# Altium schematic sheet USB2.0_SHEET.SchDoc
size A4; SheetNumber: 22; SheetTotal: 23
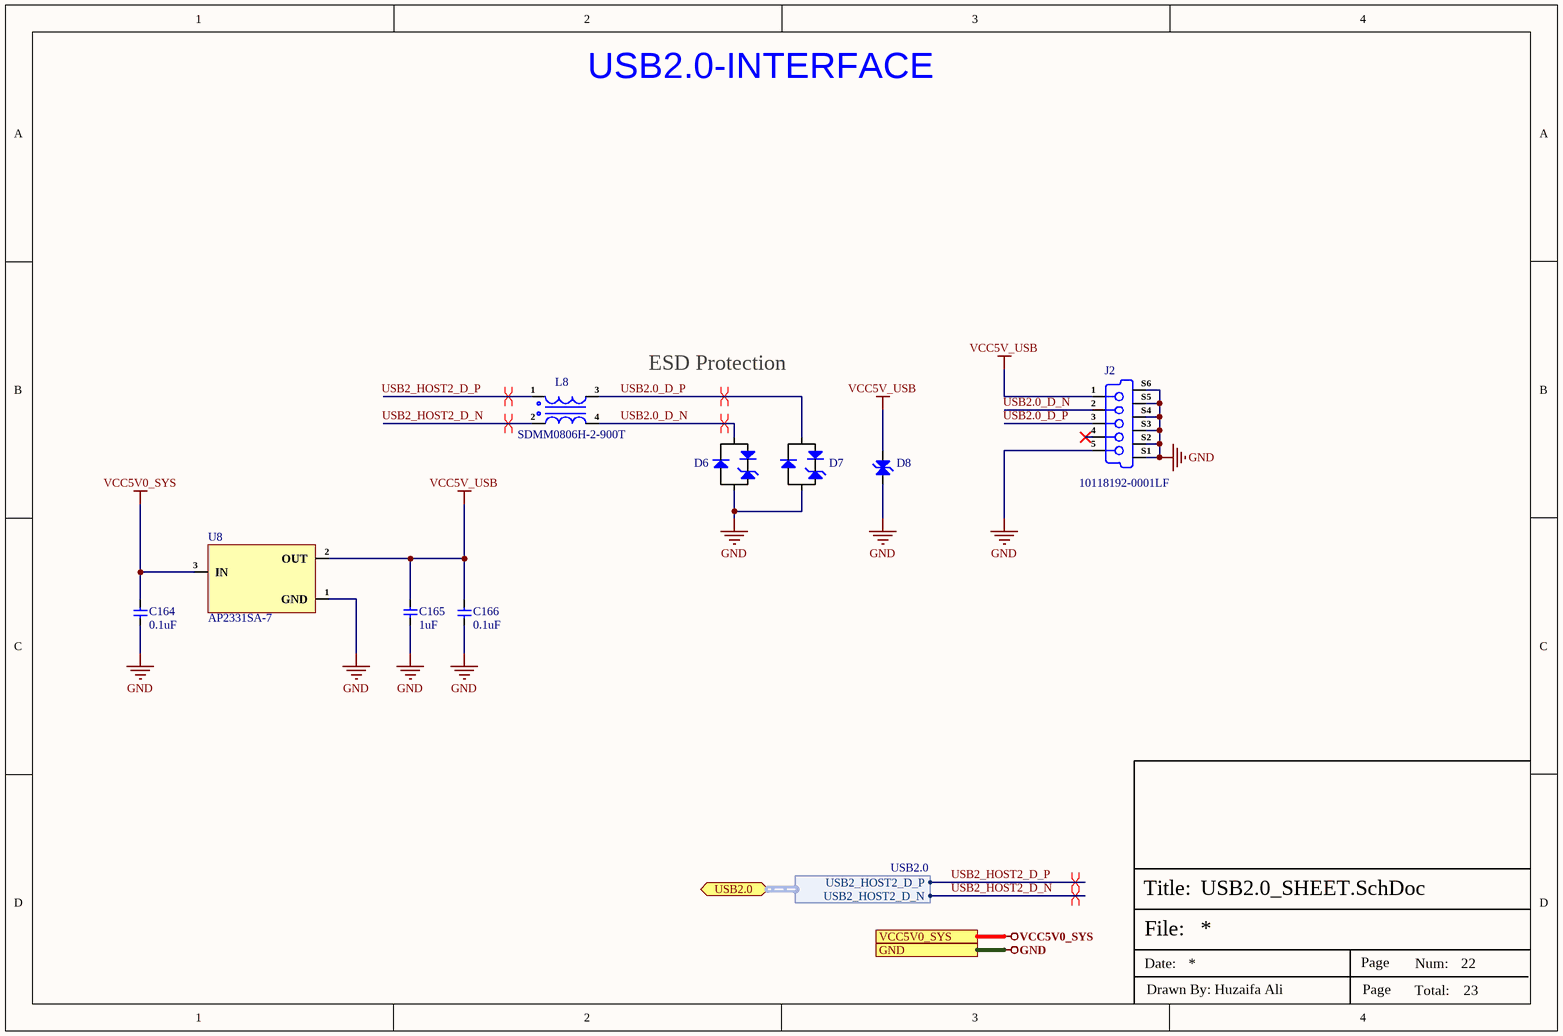
[diagram p0: USB2.0_SHEET.SchDoc]

## Parts
C164  0.1uF  [Cap-0402]
C165  1uF  [Cap-0402]
C166  0.1uF  [Cap-0402]
D6  ESD9X5VU  [DFN1006-2L_]  (value not drawn)
D7  ESD9X5VU  [DFN1006-2L_]  (value not drawn)
D8  ESD5451N  [DFN1006-2L (Bi-Directional)]  (value not drawn)
J2  10118192-0001LF  [10118192-0001LF_]
L8  SDMM0806H-2-900T  [0302]
U8  AP2331SA-7  [SOT-23]

## Ports
GND (see DRAM_LPDDR4_SHEET[6D], eMMC_SPI-FLASH_SHEET[1D], HDMI2.0_SHEET[3D], POWER_LDO_SHEET[3D], POWER_OTHER_SHEET[3C], POWER_PMIC_RK809_CODEC[3C], POWER_PMIC_RK809_DC DC[3D], POWER_PMIC_RK809_LDO[4C], POWER_PMIC_RK809_MGM[3D], RK3566_AUDIO_SHEET[3C], RK3566_DDR-PHY_SHEET[5D], RK3566_FLASH-SD_SHEET[4C], RK3566_OSC_PMUIO_SHEET[5D], RK3566_POWER_SHEET[3D], RK3566_SARADC_GPIO[3D], RK3566_USB_PCIe_SHEET[3D], RK3566_VI_SHEET[3D], RK3566_VO_SHEET_1[3C], RK3566_VO_SHEET_2[4C], TYPE-C_INTERFACE_SHEET[3D], TYPE-C_TO_MIPI-CSI_SHEET[5D], WIFI-6_SHEET[3D]), USB2.0 (bidir, harness USB2.0, see RK3566_USB_PCIe_SHEET[3C]), VCC5V0_SYS (see HDMI2.0_SHEET[3D], POWER_LDO_SHEET[3D], POWER_OTHER_SHEET[3C], POWER_PMIC_RK809_CODEC[3C], POWER_PMIC_RK809_MGM[3D], RK3566_USB_PCIe_SHEET[3C], TYPE-C_INTERFACE_SHEET[3D])

## Harnesses
USB2.0: USB2_HOST2_D_P, USB2_HOST2_D_N

## Nets
GND: C164.1 C165.2 C166.1 D6.2(A) D7.2(A) D8.2(K) J2.5(GND) J2.S1(Shield) J2.S2(Shield) J2.S3(Shield) J2.S4(Shield) J2.S5(Shield) J2.S6(Shield) U8.1(GND) ; port GND
VCC5V0_SYS: C164.2 U8.3(IN) ; port VCC5V0_SYS
VCC5V_USB: C165.1 C166.2 D8.1(K) J2.1(V_BUS_(5V)) U8.2(OUT)
USB2.0_D_N: D6.1(K) J2.2(D-) L8.4
USB2.0_D_P: D7.1(K) J2.3(D+) L8.3
USB2_HOST2_D_N: L8.2 ; port USB2.0.USB2_HOST2_D_N
USB2_HOST2_D_P: L8.1 ; port USB2.0.USB2_HOST2_D_P

Not connected (* = marked no-connect by the designer): J2 4(NC)*

## Layout directives
differential pair: USB2_HOST2_D_N, USB2_HOST2_D_P
differential pair; differential pair class USB: USB2.0_D_N, USB2.0_D_P, USB2_HOST2_D_N, USB2_HOST2_D_P

## Notes on the sheet
- USB2.0-INTERFACE
- ESD Protection
- File:
- Title:
- Date:
- Page
- Num:
- Total:
- Drawn By: Huzaifa Ali

## Library data of the parts
C164 C166 = GRM155R71H104ME14D: CAP CER 0.1UF 50V X7R 0402; Manufacturer: Murata; Tolerance: 20%; Capacitance: 100nF; Item Type: Capacitor; Supplier 1: Avnet; Manufacturer Part Number: GRM155R71H104ME14D; RoHS: Yes; Category: Ceramic Capacitors; Stock 1: 100000; Pricing 1: 10000=0.00444, 20000=0.00420, 40000=0.00396, 60000=0.00372, 80000=0.00348, 100000=0.00324, 1000000=0.00300 (USD); Mount: Surface Mount; Case/Package: 0402; Min Operating Temperature: -55°C; Max Operating Temperature: 125°C; Packaging: Cut Tape; Voltage Rating: 50V; Length: 0.039inch; Width: 0.02inch; Thickness: 0.022inch; RoHS Compliant: Yes; ComponentLink1URL: http://www.mouser.com/ds/2/281/c02e-2905.pdf?src-supplier=Mouser; ComponentLink1Description: http://www.mouser.com/ds/2/281/c02e-2905.pdf?src-supplier=Mouser; ComponentLink2URL: http://search.murata.co.jp/Ceramy/image/img/A01X/G101/ENG/GRM155R71H104ME14-01.pdf?src-supplier=Digi-Key; ComponentLink2Description: http://search.murata.co.jp/Ceramy/image/img/A01X/G101/ENG/GRM155R71H104ME14-01.pdf?src-supplier=Digi-Key; ComponentLink3URL: http://psearch.en.murata.com/capacitor/product/GRM155R71H104ME14%23.pdf?src-supplier=Avnet; ComponentLink3Description: http://psearch.en.murata.com/capacitor/product/GRM155R71H104ME14%23.pdf?src-supplier=Avnet; Supplier Part Number 1: GRM155R71H104ME14D; LCSC Part Number: C182412
C165 = CC0402KRX5R6BB105: CAP CER 1UF 10V X5R 0402; Manufacturer: Yageo; Tolerance: 10%; Dissipation Factor: 15%; Item Type: Capacitor; Supplier 1: Mouser; Manufacturer Part Number: CC0402KRX5R6BB105; RoHS: Yes; Category: Ceramic Capacitors; Stock 1: 6711367; Pricing 1: 1=0.11000, 10=0.05500, 50=0.05500, 100=0.03300, 500=0.02700, 1000=0.02200, 2500=0.02100, 10000=0.01800 (USD); Mount: Surface Mount; Case/Package: 0402; Number of Pins: 2; Case Code (Metric): 1005; Case Code (Imperial): 0402; Min Operating Temperature: -55°C; Max Operating Temperature: 85°C; Capacitance: 1uF; Dielectric: X5R; Package Quantity: 1; Voltage Rating: 10V; Packaging: Tape and Reel; Voltage Rating (DC): 10V; Termination: SMD/SMT; Resistor Type: Ceramic; Series: CC; Construction: Flat; Length: 1mm; Width: 0.02inch; Height: 0.5mm; Thickness: 0.022inch; Depth: 0.5mm; Radiation Hardening: No; REACH SVHC: No SVHC; Lead Free: Lead Free; Halogen Free: Halogen Free; RoHS Compliant: Yes; ComponentLink1URL: https://datasheet.ciiva.com/176/upy-gphc-x5r-4v-to-50v-12-176704.pdf?src-supplier=Digi-Key; ComponentLink1Description: https://datasheet.ciiva.com/176/upy-gphc-x5r-4v-to-50v-12-176704.pdf?src-supplier=Digi-Key; ComponentLink2URL: https://datasheet.ciiva.com/176/mlccorderingcode-176705.pdf?src-supplier=Digi-Key; ComponentLink2Description: https://datasheet.ciiva.com/176/mlccorderingcode-176705.pdf?src-supplier=Digi-Key; ComponentLink3URL: https://datasheet.ciiva.com/176/mlccorderingcode-176706.pdf?src-supplier=Digi-Key; ComponentLink3Description: https://datasheet.ciiva.com/176/mlccorderingcode-176706.pdf?src-supplier=Digi-Key; Supplier Part Number 1: 603-CC402KRX5R6BB105; LCSC Part Number: C106254
D6 D7 = ESD9X5VU: DFN1006-2 ESD Protection Devices ROHS; Manufacturer: TECH PUBLIC; Manufacturer Part Number: ESD9X5VU; Footprint: DFN1006-2; ComponentLink1Description: LCSC; ComponentLink1URL: https://www.lcsc.com/product-detail/span-style-background-color-ff0-ESD-span-Protection-Devices_TECH-PUBLIC-ESD9X5VU_C2875160.html; LCSC Part Number: C2875160
D8 = ESD5451N: DFN1006-2(0402) ESD Protection Devices ROHS; Manufacturer: TECH PUBLIC; Manufacturer Part Number: ESD5451N; Footprint: DFN1006-2(0402); ComponentLink1Description: LCSC; ComponentLink1URL: https://www.lcsc.com/product-detail/span-style-background-color-ff0-ESD-span-Protection-Devices_TECH-PUBLIC-ESD5451N_C2936977.html; LCSC Part Number: C2936977
J2 = 10118192-0001LF: CONN RCPT USB2.0 MICRO B SMD R/A; Manufacturer: Amphenol FCI; Gender: Receptacle; Current Rating: 1.8A; Connector Type: USB,Receptacle; Number of Contacts: 5; Number of Ports: 1; Insulation Resistance: 1GR; Max Voltage Rating (AC): 100V; Pitch: 0.65mm; Item Type: USB Connector; Supplier 1: Digi-Key; Manufacturer Part Number: 10118192-0001LF; Stock 1: 32977; Pricing 1: 1=0.43, 10=0.405, 25=0.3648, 50=0.3242, 100=0.3107, 250=0.28368, 500=0.27016 (USD); Mount: Surface Mount,Horizontal; Contact Plating: Gold; Contact Material: Copper Alloy; Color: Black; Number of Terminals: 5; Housing Material: Polymer; Min Operating Temperature: -55°C; Max Operating Temperature: 85°C; Termination: Solder; Packaging: Tape and Reel; Orientation: Right Angle; Package Quantity: 1400; Features: Shielded; Voltage Rating: 100V; USB Standard: USB 2.0; Length: 7.86mm; Depth: 5.57mm; Radiation Hardening: No; Flammability Rating: UL94 V-0; Lead Free: Lead Free; REACH SVHC: No SVHC; ComponentLink1URL: https://cdn.amphenol-icc.com/media/wysiwyg/files/documentation/datasheet/inputoutput/io_usb_micro.pdf?src-supplier=Verical; ComponentLink1Description: https://cdn.amphenol-icc.com/media/wysiwyg/files/documentation/datasheet/inputoutput/io_usb_micro.pdf?src-supplier=Verical; ComponentLink2URL: http://www.amphenol-icc.com/media/wysiwyg/files/drawing/10118192.pdf?src-supplier=Digi-Key; ComponentLink2Description: http://www.amphenol-icc.com/media/wysiwyg/files/drawing/10118192.pdf?src-supplier=Digi-Key; ComponentLink3URL: https://cdn.amphenol-icc.com/media/wysiwyg/files/documentation/datasheet/inputoutput/io_usb_micro.pdf?src-supplier=Mouser; ComponentLink3Description: https://cdn.amphenol-icc.com/media/wysiwyg/files/documentation/datasheet/inputoutput/io_usb_micro.pdf?src-supplier=Mouser; Supplier Part Number 1: 609-4613-6-ND; LCSC Part Number: C132564
L8 = SDMM0806H-2-900T: 90Ω@100MHz 4Ω 2 0302 Common Mode Filters ROHS; Manufacturer: Sunlord; Manufacturer Part Number: SDMM0806H-2-900T; Package: 0302; LCSC Part Number: C370285; Item Type: Common Mode Filter; ComponentLink1Description: LCSC; ComponentLink1URL: https://www.lcsc.com/product-detail/Common-Mode-Filters_Sunlord-SDMM0806H-2-900T_C370285.html
U8 = AP2331SA-7: IC CURRENT SWITCH SOT23-3; Manufacturer: Diodes; Supplier: Digikey; Supplier Part Number: AP2331SA-7DICT-ND; Manufacturer Part Number: AP2331SA-7; RoHS: Yes; Category: Hot Swap Controllers; Stock: 19607; Pricing: 1=0.45, 10=0.383, 25=0.3572, 100=0.2859, 250=0.26548, 500=0.22464, 1000=0.17359 (USD); ComponentLink1URL: https://datasheet.ciiva.com/15108/getdatasheetpartid-670771-15108880.pdf?src-supplier=Verical; ComponentLink1Description: https://datasheet.ciiva.com/15108/getdatasheetpartid-670771-15108880.pdf?src-supplier=Verical; ComponentLink2URL: https://datasheet.ciiva.com/4923/ap2331-6844-4923636.pdf?src-supplier=Mouser; ComponentLink2Description: https://datasheet.ciiva.com/4923/ap2331-6844-4923636.pdf?src-supplier=Mouser; ComponentLink3URL: https://datasheet.ciiva.com/8142/ap2331-8142774.pdf?src-supplier=Avnet; ComponentLink3Description: https://datasheet.ciiva.com/8142/ap2331-8142774.pdf?src-supplier=Avnet; ComponentLink4URL: https://datasheet.ciiva.com/1962/ap2331-1962167.pdf?src-supplier=Digikey; ComponentLink4Description: https://datasheet.ciiva.com/1962/ap2331-1962167.pdf?src-supplier=Digikey; ComponentLink5URL: https://datasheet.ciiva.com/1962/ap2331-1962168.pdf?src-supplier=Digikey; ComponentLink5Description: https://datasheet.ciiva.com/1962/ap2331-1962168.pdf?src-supplier=Digikey; ComponentLink6URL: https://datasheet.ciiva.com/1962/ap2331-1962169.pdf?src-supplier=Digikey; ComponentLink6Description: https://datasheet.ciiva.com/1962/ap2331-1962169.pdf?src-supplier=Digikey; LCSC Part Number: C500764; Item Type: IC